# Altium project ECG_Signal_Acquisition_Device.PrjPcb
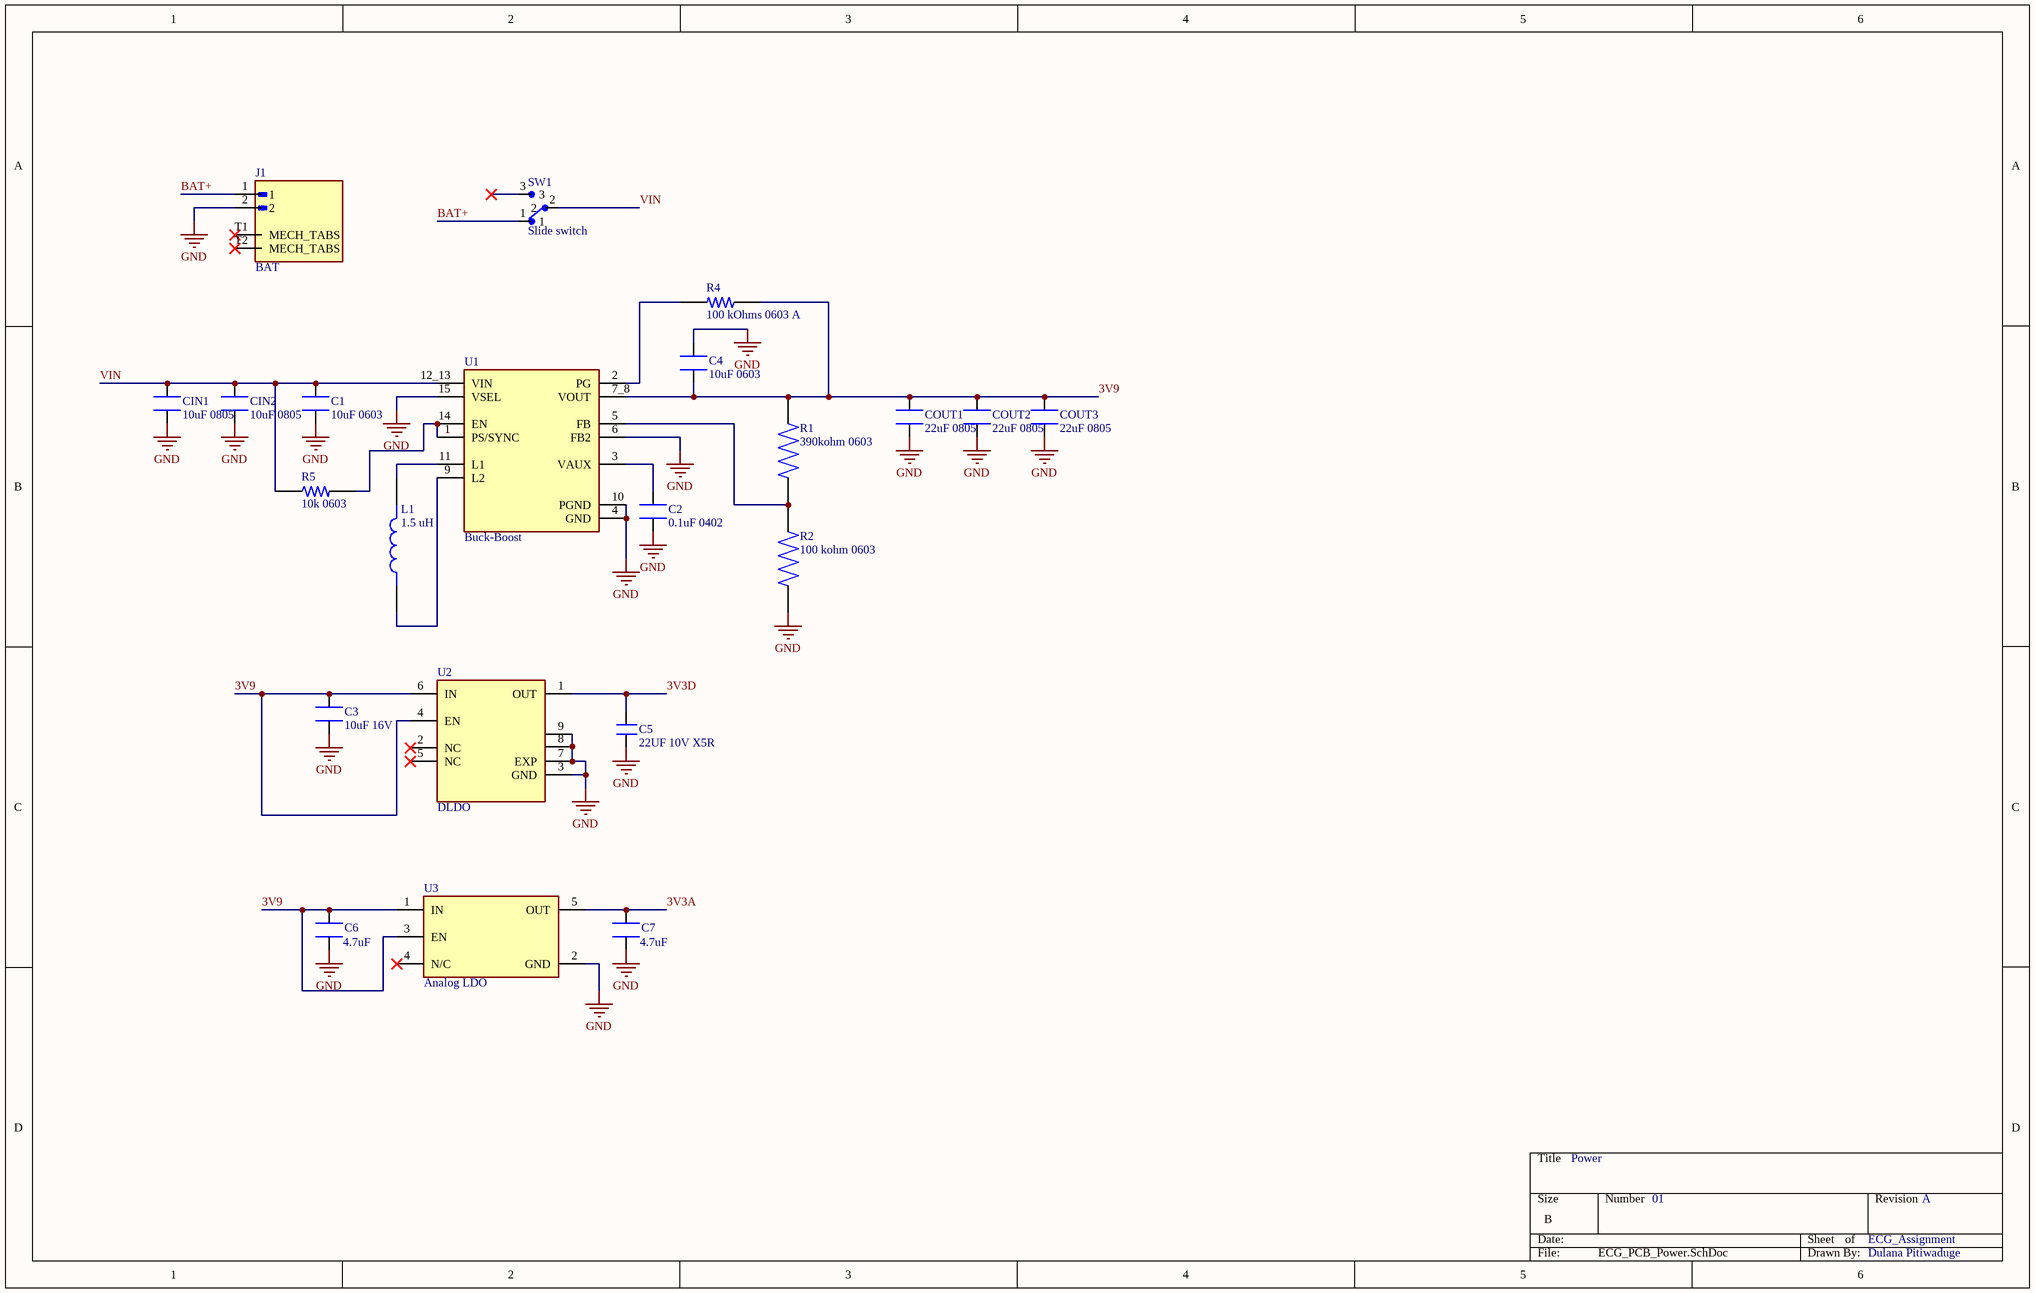
[diagram p0: ECG_PCB_Power.SchDoc]
2 sheets, 69 parts. Net scope: global (net labels, ports and power ports of the same name join across sheets).
Board file: ECG_PCB.PcbDoc
Sheets:
  ECG_PCB_Power.SchDoc
  ECG_Signal.SchDoc

## Sheet ECG_PCB_Power.SchDoc
size B; SheetNumber: 1; SheetTotal: 2

### Parts
C1  10uF 0603  [CAPC1608X100N]
C2  0.1uF 0402  [CAPC1005X55N]
C3  10uF 16V  [CAPC2012X135N]
C4  10uF 0603  [CAPC1608X100N]
C5  22UF 10V X5R  [CAP_GRM21B_MUR]
C6  4.7uF  [CAPC2012X135N]
C7  4.7uF  [CAPC2012X135N]
CIN1  10uF 0805  [CAPC2012X145N]
CIN2  10uF 0805  [CAPC2012X145N]
COUT1  22uF 0805  [CAPC2012X145N]
COUT2  22uF 0805  [CAPC2012X145N]
COUT3  22uF 0805  [CAPC2012X145N]
J1  BAT  [JST_S2B-PH-SM4-TB]
L1  1.5 uH  [IND_XFL4020-152MEC]
R1  390kohm 0603  [RESC1608X55N]
R2  100 kohm 0603  [RESC1508X50N]
R4  100 kOhms 0603 A  [RESC1607X60N]
R5  10k 0603  [RESC1607X60N]
SW1  Slide switch  [SW_1101M2S3CQE2]
U1  Buck-Boost  [VREG_TPS63070RNMR]
U2  DLDO  [VREG_TLV75733PDRVR]
U3  Analog LDO  [SOT95P280X145-5N]

### Nets
GND: C1.1 C2.1 C3.1 C4.1 C5.1 C6.2 C7.2 CIN1.1 CIN2.1 COUT1.1 COUT2.1 COUT3.1 J1.2 R2.1 U1.4(GND) U1.6(FB2) U1.10(PGND) U1.15(VSEL) U2.3(GND) U2.7(EXP) U2.8 U2.9(OUT) U3.2(GND)
3V3A: C7.1 U3.5(OUT)
3V3D: C5.2 U2.1(OUT)
3V9: C3.2 C4.2 C6.1 COUT1.2 COUT2.2 COUT3.2 R1.2 R4.1 U1.7_8(VOUT) U2.4(EN) U2.6(IN) U3.1(IN) U3.3(EN)
BAT+: J1.1 SW1.1
VIN: C1.2 CIN1.2 CIN2.2 R5.1 SW1.2 U1.12_13(VIN)
NetC2_2: C2.2 U1.3(VAUX)
NetL1_1: L1.1 U1.9(L2)
NetL1_2: L1.2 U1.11(L1)
NetR1_1: R1.1 R2.2 U1.5(FB)
NetR4_2: R4.2 U1.2(PG)
NetR5_2: R5.2 U1.1(PS/SYNC) U1.14(EN)

Not connected (* = marked no-connect by the designer): J1 T1(MECH_TABS)* T2(MECH_TABS)*; SW1 3*; U2 2(NC)* 5(NC)*; U3 4(N/C)*

### Notes on the sheet
- Power
- 01
- ECG_Assignment
- A
- Dulana Pitiwaduge

### Library data of the parts
C1 C4 = MSAST168BB5106MTNA01: 10uF 25V 20% Multilayer Ceramic Capacitor X5R 0603 (1608 Metric); MANUFACTURER: Taiyo Yuden; MAXIMUM_PACKAGE_HEIGHT: 1.00mm; Package: 1608-2 TAIYO; MPN: MSAST168BB5106MTNA01; Value: *; SOURCE_URL: https://www.snapeda.com/parts/MSAST168BB5106MTNA01/Taiyo+Yuden/view-part/; DATASHEET_URL: https://snapeda.s3.amazonaws.com/datasheet/Taiyo_Yuden_MLCC_S.pdf; STANDARD: IPC-7351B
C2 = MSAST105SB7104MFNB25: CAP CER 0.1UF 25V X7R 0402; MANUFACTURER: Taiyo Yuden; MPN: MSAST105SB7104MFNB25; MAXIMUM_PACKAGE_HEIGHT: 0.55mm; Value: *; STANDARD: IPC-7351B
C3 = GRM21BR61C106KE15L: 10 ÂµF Â±10% 16V Ceramic Capacitor X5R 0805 (2012 Metric); MF: Murata; SnapEDA_Link: https://www.snapeda.com/parts/GRM21BR61C106KE15L/Murata/view-part/?ref=snap; Package: 805-2 Murata; Value: *; MP: GRM21BR61C106KE15L; Check_prices: https://www.snapeda.com/parts/GRM21BR61C106KE15L/Murata/view-part/?ref=eda
C5 = GRM21BR61A226ME44L: CAP CER 22UF 10V X5R 0805; Manufacturer_Name: Murata; Type: Ceramic Capacitors; Copyright: Copyright (C) 2026 Ultra Librarian. All rights reserved.; Manufacturer_Part_Number: GRM21BR61A226ME44L
C6 C7 = GRM21BR71A475KA73L: SMD Capacitor X7R(EIA) with Capacitance: 4.7uF Tol. 10%. Rated Voltage: 10Vdc; MF: Murata; SnapEDA_Link: https://www.snapeda.com/parts/GRM21BR71A475KA73L/Murata/view-part/?ref=snap; Package: 2012 Murata; Value: *; MP: GRM21BR71A475KA73L; Check_prices: https://www.snapeda.com/parts/GRM21BR71A475KA73L/Murata/view-part/?ref=eda
CIN1 CIN2 = GRM21BC71E106ME11L: 0805 10 uF 25 V Â±20% Tolerance X7S Multilayer Ceramic Capacitor; MF: Murata; SnapEDA_Link: https://www.snapeda.com/parts/GRM21BC71E106ME11L/Murata/view-part/?ref=snap; Package: 2012 Murata; Value: *; MP: GRM21BC71E106ME11L; Check_prices: https://www.snapeda.com/parts/GRM21BC71E106ME11L/Murata/view-part/?ref=eda
COUT1-COUT3 = GRM21BC81C226ME44L: 0805 22 uF 16 V Â±20% Tolerance X6S Multilayer Ceramic Chip Capacitor; MF: Murata Electronics; SnapEDA_Link: https://www.snapeda.com/parts/GRM21BC81C226ME44L/Murata+Electronics+North+America/view-part/?ref=snap; Package: 2012 Murata; Value: *; MP: GRM21BC81C226ME44L; Check_prices: https://www.snapeda.com/parts/GRM21BC81C226ME44L/Murata+Electronics+North+America/view-part/?ref=eda
J1 = S2B-PH-SM4-TB: MANUFACTURER: JST Sales; UNIT: MM; MAXIMUM_PACKAGE_HEIGHT: 5.5mm; MPN: S2B-PH-SM4-TB; STANDARD: Manufacturer Recommendations; Value: *
L1 = XFL4020-152MEC: Inductor Power Shielded Wirewound 1.5uH 20% 100KHz 9.1A 15.8mOhm DCR 1515 Automotive Embossed Plastic T/R; MF: Coilcraft; SnapEDA_Link: https://www.snapeda.com/parts/XFL4020-152MEC/Coilcraft/view-part/?ref=snap; Package: None; Value: *; MP: XFL4020-152MEC; Check_prices: https://www.snapeda.com/parts/XFL4020-152MEC/Coilcraft/view-part/?ref=eda
R1 = RT0603BRD07390KL: 390 kOhms Â±0.1% 0.1W, 1/10W Chip Resistor 0603 (1608 Metric) Thin Film; MANUFACTURER: Yageo; Package: 1608 Yageo; MPN: RT0603BRD07390KL; DATASHEET_URL: https://s3.amazonaws.com/snapeda/datasheet/RT0603BRD07390KL_Yageo.pdf; Value: *; SOURCE_URL: https://www.snapeda.com/parts/RT0603BRD07390KL/Yageo/view-part/
R2 = CRCW0603100KFKEA: Resistor, Thick Film, 100 Kilohms, 0.1W, 1%, SMT, TCR 37 ppm/DegC, Tape and Reel | Vishay Dale CRCW0603100KFKEA; SnapEDA_Link: https://www.snapeda.com/parts/CRCW0603100KFKEA/Vishay+Dale/view-part/?ref=snap; Package: 1508 Vishay; Value: *; MF: Vishay; MP: CRCW0603100KFKEA; Check_prices: https://www.snapeda.com/parts/CRCW0603100KFKEA/Vishay+Dale/view-part/?ref=eda
R4 = RC0603FR-07100KL: 100 kOhms Â±1% 0.1W, 1/10W Chip Resistor 0603 (1608 Metric) Moisture Resistant Thick Film; MF: Yageo; SnapEDA_Link: https://www.snapeda.com/parts/RC0603FR-07100KL/Yageo/view-part/?ref=snap; Package: 0603 Yageo; Value: *; MP: RC0603FR-07100KL; Check_prices: https://www.snapeda.com/parts/RC0603FR-07100KL/Yageo/view-part/?ref=eda
R5 = RC0603FR-0710KL: 10 kOhms Â±1% 0.1W, 1/10W Chip Resistor 0603 (1608 Metric) Moisture Resistant Thick Film; MF: Yageo; SnapEDA_Link: https://www.snapeda.com/parts/RC0603FR-0710KL/Yageo/view-part/?ref=snap; Package: 0603 Yageo; Value: *; MP: RC0603FR-0710KL; Check_prices: https://www.snapeda.com/parts/RC0603FR-0710KL/Yageo/view-part/?ref=eda
SW1 = 1101M2S3CQE2: Switch,Slide,Sealed,SPDT,ON-NONE-ON,PC Mnt,.200 Blk Act,6A,120VAC,PC Thru-Hole | C&K 1101M2S3CQE2; SnapEDA_Link: https://www.snapeda.com/parts/1101M2S3CQE2/C%2526K/view-part/?ref=snap; Package: None; Value: *; MF: C&K; MP: 1101M2S3CQE2; Check_prices: https://www.snapeda.com/parts/1101M2S3CQE2/C%2526K/view-part/?ref=eda
U1 = TPS63070RNMR: Wide input voltage (2V-16V) buck-boost converter; MF: Texas Instruments; SnapEDA_Link: https://www.snapeda.com/parts/TPS63070RNMR/Texas+Instruments/view-part/?ref=snap; Package: VQFN-HR-15 Texas Instruments; Value: *; MP: TPS63070RNMR; Check_prices: https://www.snapeda.com/parts/TPS63070RNMR/Texas+Instruments/view-part/?ref=eda
U2 = TLV75733PDRVR: 1-A, low-IQ high-accuracy low-dropout (LDO) voltage regulator with enable; MF: Texas Instruments; SnapEDA_Link: https://www.snapeda.com/parts/TLV75733PDRVR/Texas+Instruments/view-part/?ref=snap; Package: WSON-6 Texas Instruments; Value: *; MP: TLV75733PDRVR; Check_prices: https://www.snapeda.com/parts/TLV75733PDRVR/Texas+Instruments/view-part/?ref=eda
U3 = TPS7A2033PDBVR: 300-mA ultra-low-noise low-IQ low-dropout (LDO) linear regulator with high PSRR; MF: Texas Instruments; SnapEDA_Link: https://www.snapeda.com/parts/TPS7A2033PDBVR/Texas+Instruments/view-part/?ref=snap; Package: SOT-23 Texas Instruments; Value: *; MP: TPS7A2033PDBVR; Check_prices: https://www.snapeda.com/parts/TPS7A2033PDBVR/Texas+Instruments/view-part/?ref=eda

## Sheet ECG_Signal.SchDoc
size A3; SheetNumber: 2; SheetTotal: 2
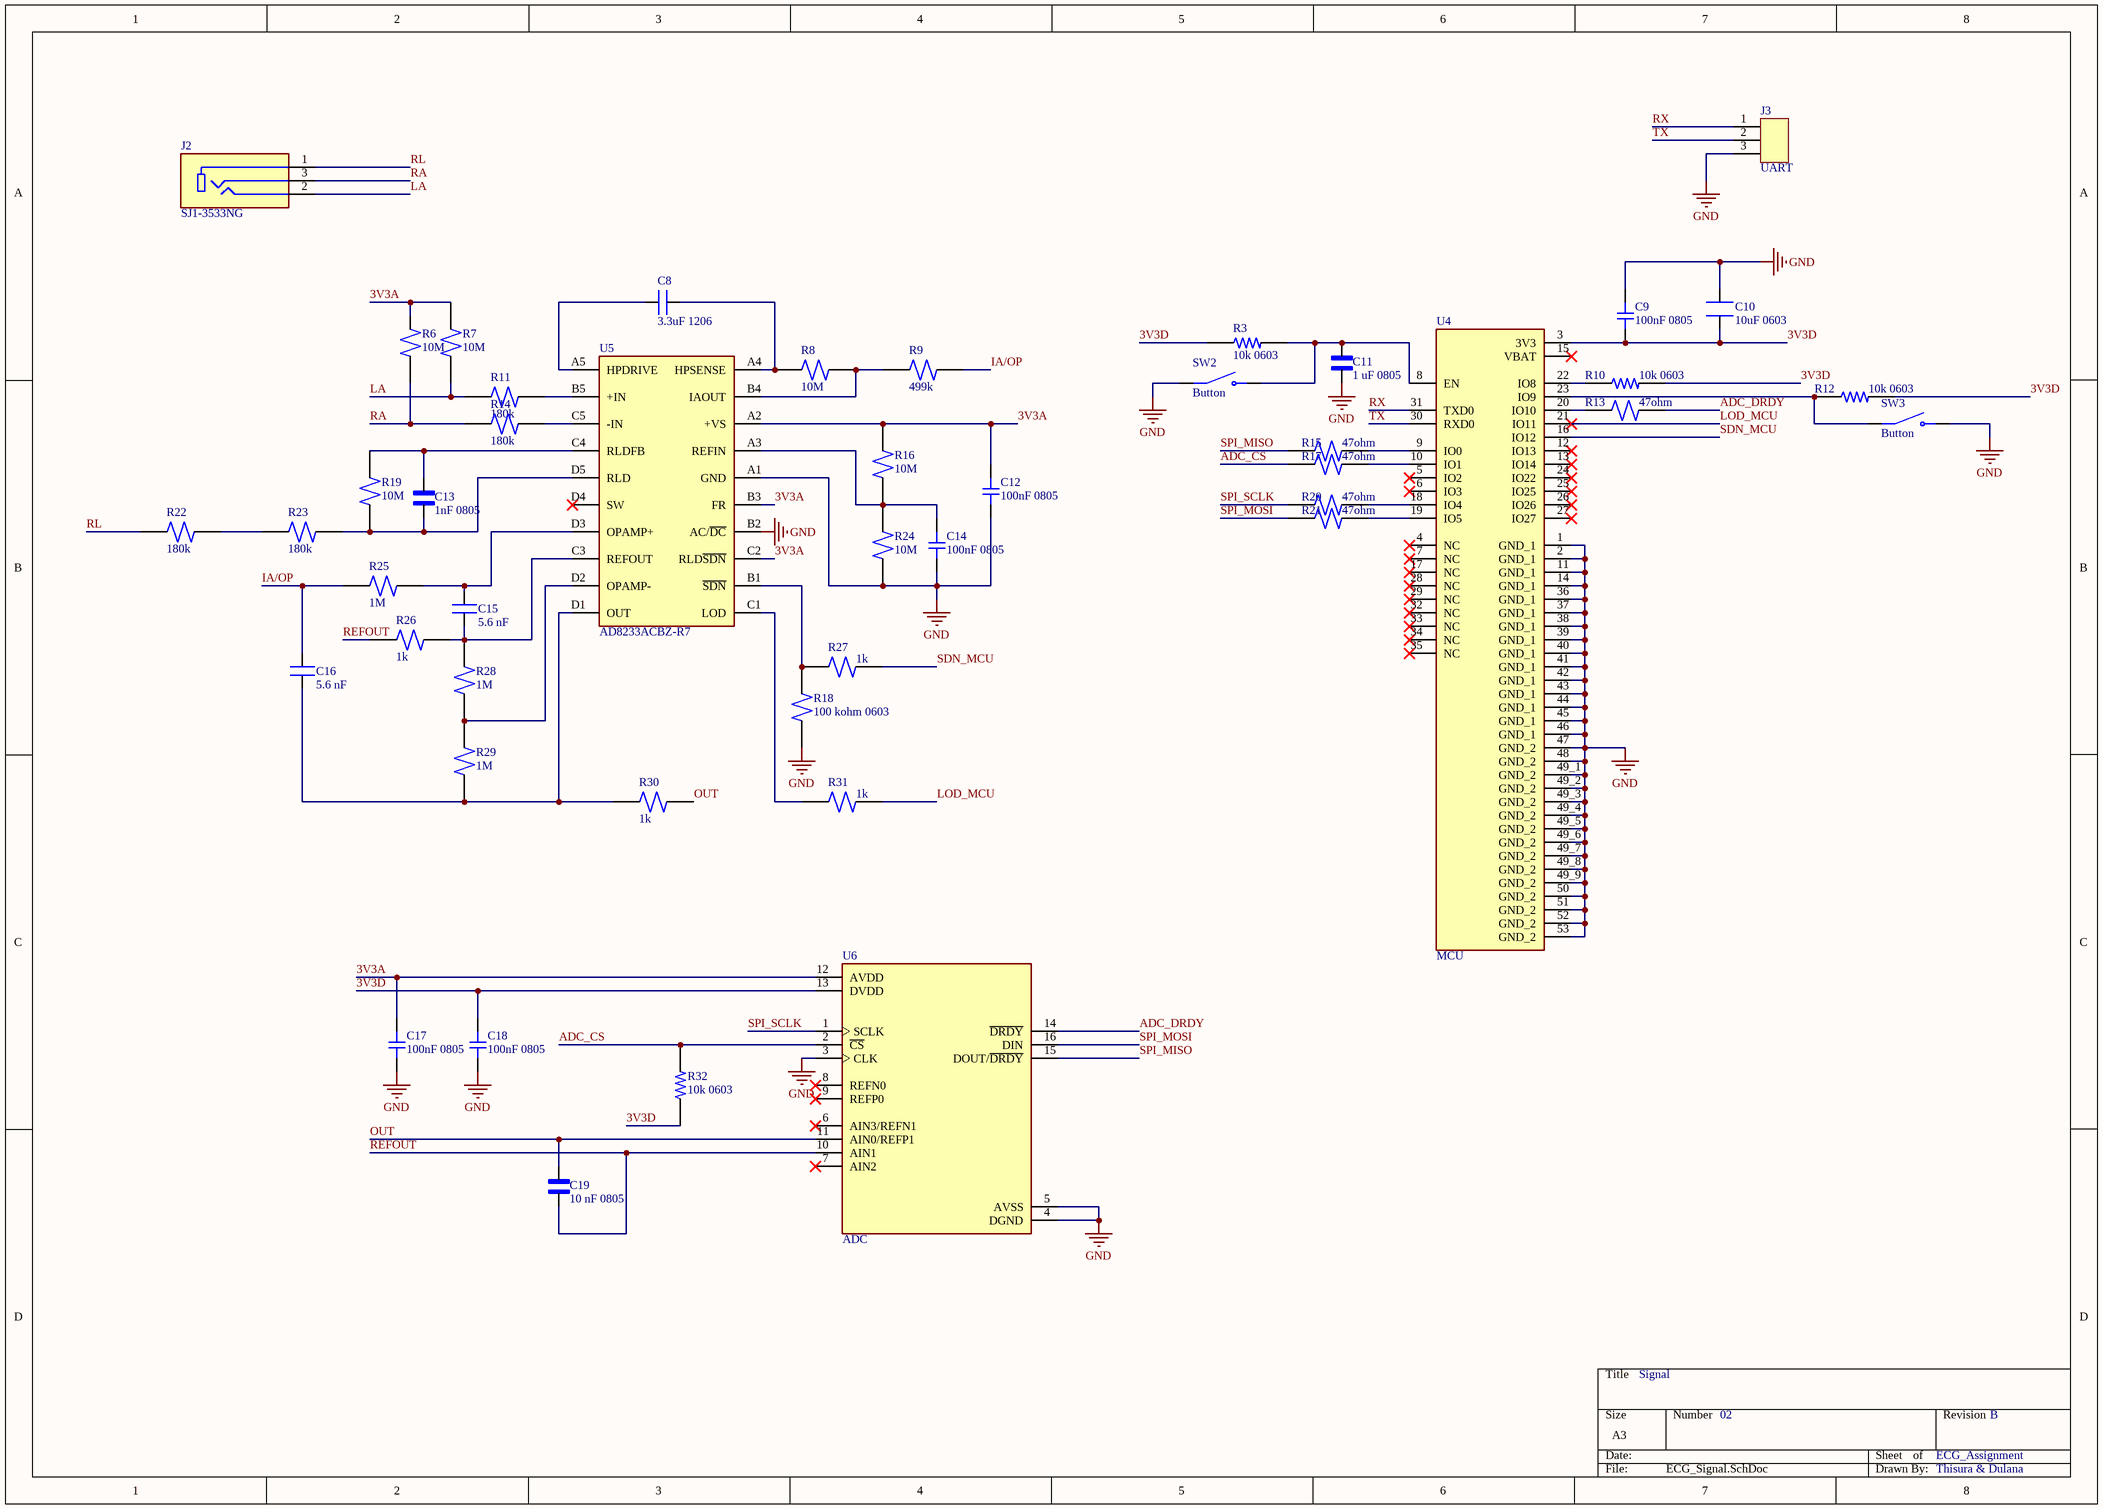
[diagram p1: ECG_Signal.SchDoc]

### Parts
C8  3.3uF 1206  [CAPC340180_180N_KEM]
C9  100nF 0805  [CAPC2012X88N]
C10  10uF 0603  [CAPC1608X100N]
C11  1 uF 0805  [CAPC2012X88N]
C12  100nF 0805  [CAPC2012X88N]
C13  1nF 0805  [CAPC2012X88N]
C14  100nF 0805  [CAPC2012X88N]
C15  5.6 nF  [CAPC220145_88N_KEM]
C16  5.6 nF  [CAPC220145_88N_KEM]
C17  100nF 0805  [CAPC2012X88N]
C18  100nF 0805  [CAPC2012X88N]
C19  10 nF 0805  [CAPC2012X140N]
J2  SJ1-3533NG  [CUI_SJ1-3533NG]
J3  UART  [CONN_PH1-03-UA_ADM]
R3  10k 0603  [RESC1607X60N]
R6  10M  [RESC2012X60N]
R7  10M  [RESC2012X60N]
R8  10M  [RESC2012X60N]
R9  499k  [RESC2012X60N]
R10  10k 0603  [RESC1607X60N]
R11  180k  [RESC2012X60N]
R12  10k 0603  [RESC1607X60N]
R13  47ohm  [RESC1005X35N]
R14  180k  [RESC2012X60N]
R15  47ohm  [RESC1005X35N]
R16  10M  [RESC2012X60N]
R17  47ohm  [RESC1005X35N]
R18  100 kohm 0603  [RESC1508X50N]
R19  10M  [RESC2012X60N]
R20  47ohm  [RESC1005X35N]
R21  47ohm  [RESC1005X35N]
R22  180k  [RESC2012X60N]
R23  180k  [RESC2012X60N]
R24  10M  [RESC2012X60N]
R25  1M  [RESC2012X60N]
R26  1k  [RESC2012X60N]
R27  1k  [RESC2012X60N]
R28  1M  [RESC2012X60N]
R29  1M  [RESC2012X60N]
R30  1k  [RESC2012X60N]
R31  1k  [RESC2012X60N]
R32  10k 0603  [RESC1607X60N]
SW2  Button  [SW_B3U-1000P]
SW3  Button  [SW_B3U-1000P]
U4  MCU  [MODULE_ESP32-H2-MINI-1-H2]
U5  AD8233ACBZ-R7  [BGA20N40P5X4_204X170X56N]
U6  ADC  [SOP65P640X120-16N]

### Nets
GND: C9.1(A) C10.2 C11.2 C12.2(B) C14.2(B) C17.1(A) C18.1(A) J3.3 R18.1 R24.1 SW2.1 SW3.2 U4.1(GND_1) U4.2(GND_1) U4.11(GND_1) U4.14(GND_1) U4.36(GND_1) U4.37(GND_1) U4.38(GND_1) U4.39(GND_1) U4.40(GND_1) U4.41(GND_1) U4.42(GND_1) U4.43(GND_1) U4.44(GND_1) U4.45(GND_1) U4.46(GND_1) U4.47(GND_2) U4.48(GND_2) U4.49_1(GND_2) U4.49_2(GND_2) U4.49_3(GND_2) U4.49_4(GND_2) U4.49_5(GND_2) U4.49_6(GND_2) U4.49_7(GND_2) U4.49_8(GND_2) U4.49_9(GND_2) U4.50(GND_2) U4.51(GND_2) U4.52(GND_2) U4.53(GND_2) U5.A1(GND) U5.B2(AC/~{DC}) U6.3(CLK) U6.4(DGND) U6.5(AVSS)
3V3A: C12.1(A) C17.2(B) R6.2 R7.2 R16.2 U5.A2(+VS) U5.B3(FR) U5.C2(RLD~{SDN}) U6.12(AVDD)
3V3D: C9.2(B) C10.1 C18.2(B) R3.1 R10.2 R12.2 R32.1 U4.3(3V3) U6.13(DVDD)
ADC_CS: R17.1 R32.2 U6.2(~{CS})
ADC_DRDY: R13.2 U6.14(~{DRDY})
IA/OP: C16.1 R9.2 R25.1
LA: J2.2 R7.1 R11.1
LOD_MCU: R31.2 U4.21(IO11)
OUT: C19.2 R30.2 U6.11(AIN0/REFP1)
RA: J2.3 R6.1 R14.1
REFOUT: C19.1 R26.1 U6.10(AIN1)
RL: J2.1 R22.1
RX: J3.1 U4.31(TXD0)
SDN_MCU: R27.2 U4.16(IO12)
SPI_MISO: R15.1 U6.15(DOUT/~{DRDY})
SPI_MOSI: R21.1 U6.16(DIN)
SPI_SCLK: R20.1 U6.1(SCLK)
TX: J3.2 U4.30(RXD0)
NetC8_1: C8.1 U5.A5(HPDRIVE)
NetC8_2: C8.2 R8.1 U5.A4(HPSENSE)
NetC11_1: C11.1 R3.2 SW2.2 U4.8(EN)
NetC13_1: C13.1 R19.1 R23.2 U5.D5(RLD)
NetC13_2: C13.2 R19.2 U5.C4(RLDFB)
NetC14_1: C14.1(A) R16.1 R24.2 U5.A3(REFIN)
NetC15_1: C15.1 R26.2 R28.2 U5.C3(REFOUT)
NetC15_2: C15.2 R25.2 U5.D3(OPAMP+)
NetC16_2: C16.2 R29.1 R30.1 U5.D1(OUT)
NetR8_2: R8.2 R9.1 U5.B4(IAOUT)
NetR10_1: R10.1 U4.22(IO8)
NetR11_2: R11.2 U5.B5(+IN)
NetR12_1: R12.1 SW3.1 U4.23(IO9)
NetR13_1: R13.1 U4.20(IO10)
NetR14_2: R14.2 U5.C5(-IN)
NetR15_2: R15.2 U4.9(IO0)
NetR17_2: R17.2 U4.10(IO1)
NetR18_2: R18.2 R27.1 U5.B1(~{SDN})
NetR20_2: R20.2 U4.18(IO4)
NetR21_2: R21.2 U4.19(IO5)
NetR22_2: R22.2 R23.1
NetR28_1: R28.1 R29.2 U5.D2(OPAMP-)
NetR31_1: R31.1 U5.C1(LOD)

Not connected (* = marked no-connect by the designer): U4 4(NC)* 5(IO2)* 6(IO3)* 7(NC)* 12(IO13)* 13(IO14)* 15(VBAT)* 17(NC)* 24(IO22)* 25(IO25)* 26(IO26)* 27(IO27)* 28(NC)* 29(NC)* 32(NC)* 33(NC)* 34(NC)* 35(NC)*; U5 D4(SW)*; U6 6(AIN3/REFN1)* 7(AIN2)* 8(REFN0)* 9(REFP0)*

### Notes on the sheet
- Signal
- 02
- ECG_Assignment
- B
- Thisura & Dulana

### Library data of the parts
C8 = C1206C335K3RACTU: SMD Comm X7R, Ceramic, 3.3 uF, 10%, 25 VDC, X7R, SMD, MLCC, Temperature Stable, Class II, 1206; Manufacturer_Name: Kemet; Copyright: Copyright (C) 2026 Ultra Librarian. All rights reserved.; Manufacturer_Part_Number: C1206C335K3RACTU; Datasheet: https://content.kemet.com/datasheets/KEM_C1002_X7R_SMD.pdf
C9 C12 C14 C17 C18 = C0805C104K5RACTU: Capacitor, Ceramic, Cap, .100uF, Tol 10%, SMT, 50V, X7R, Tape/Reel | KEMET C0805C104K5RACTU; SnapEDA_Link: https://www.snapeda.com/parts/C0805C104K5RACTU/KEMET/view-part/?ref=snap; Package: Package; Value: *; MF: KEMET; MP: C0805C104K5RACTU; Check_prices: https://www.snapeda.com/parts/C0805C104K5RACTU/KEMET/view-part/?ref=eda
C10 = MSAST168BB5106MTNA01: as C1 on sheet ECG_PCB_Power; MAXIMUM_PACKAGE_HEIGHT: 1.00mm; Package: 1608-2 TAIYO; MPN: MSAST168BB5106MTNA01; Value: *; SOURCE_URL: https://www.snapeda.com/parts/MSAST168BB5106MTNA01/Taiyo+Yuden/view-part/; DATASHEET_URL: https://snapeda.s3.amazonaws.com/datasheet/Taiyo_Yuden_MLCC_S.pdf; STANDARD: IPC-7351B
C11 = C0805C105K4RACTU: Capacitor,Ceramic,Cap 1 uF,Tol 10%,Vol-Rtg 16 VDC,SMT,0805,X7R,Tape & Reel | KEMET C0805C105K4RACTU; SnapEDA_Link: https://www.snapeda.com/parts/C0805C105K4RACTU/KEMET/view-part/?ref=snap; Package: 805-2 KEMET; Value: *; MF: KEMET; MP: C0805C105K4RACTU; Check_prices: https://www.snapeda.com/parts/C0805C105K4RACTU/KEMET/view-part/?ref=eda
C13 = C0805C102J5GACTU: CAP, 1000PF, 50V, 5%, C0G/NP0, 0805; Capacitance:1000pF; Voltage Rating:50V; Ceramic Capacitor Case:0805 [2012 Metric]; Capacitance Tolerance:Â± 5%; Dielectric Characteristic:C0G / NP0; Product Range:C Series KEMET; Opera; MP: C0805C102J5GAC-TU; SnapEDA_Link: https://www.snapeda.com/parts/C0805C102J5GAC-TU/Kemet/view-part/?ref=snap; Package: Package; Value: *; MF: KEMET; Check_prices: https://www.snapeda.com/parts/C0805C102J5GAC-TU/Kemet/view-part/?ref=eda
C15 C16 = C0805C562J5GACTU: SMD Comm C0G, Ceramic, 5600 pF, 5%, 50 VDC, C0G, SMD, MLCC, Ultra-Stable, Low Loss, Class I, 0805; Manufacturer_Name: Kemet; Copyright: Copyright (C) 2025 Ultra Librarian. All rights reserved.; Manufacturer_Part_Number: C0805C562J5GACTU
C19 = C0805C103J5GACTU: 0805 C 10nF Ceramic Multilayer Capacitor, 50 V, +125degC, C0G Dielectric, +/-5% | KEMET C0805C103J5GACTU; SnapEDA_Link: https://www.snapeda.com/parts/C0805C103J5GACTU/KEMET/view-part/?ref=snap; Package: 0805 Kemet; Value: *; MF: KEMET; MP: C0805C103J5GACTU; Check_prices: https://www.snapeda.com/parts/C0805C103J5GACTU/KEMET/view-part/?ref=eda
J2 = SJ1-3533NG: 3.5 mm Right-Angle Stereo Jack, 3 Pin PCB Mount, Isolated Ground; MF: Same Sky; SnapEDA_Link: https://www.snapeda.com/parts/SJ1-3533NG/Same+Sky/view-part/?ref=snap; Package: None; Value: *; MP: SJ1-3533NG; Check_prices: https://www.snapeda.com/parts/SJ1-3533NG/Same+Sky/view-part/?ref=eda
J3 = PH1-03-UA: Description; Manufacturer_Name: ADAM TECHNOLOGIES INC; Copyright: Copyright (C) 2025 Ultra Librarian. All rights reserved.; Manufacturer_Part_Number: PH1-03-UA; RefDes: RefDes; Type: Type
R3 R10 R12 R32 = RC0603FR-0710KL: as R5 on sheet ECG_PCB_Power; SnapEDA_Link: https://www.snapeda.com/parts/RC0603FR-0710KL/Yageo/view-part/?ref=snap; Package: 0603 Yageo; Value: *; MP: RC0603FR-0710KL; Check_prices: https://www.snapeda.com/parts/RC0603FR-0710KL/Yageo/view-part/?ref=eda
R6-R8 R16 R19 R24 = RC0805FR-0710ML: 10 MOhms Â±1% 0.125W, 1/8W Chip Resistor 0805 (2012 Metric) Moisture Resistant Thick Film; MF: Yageo; SnapEDA_Link: https://www.snapeda.com/parts/RC0805FR-0710ML/Yageo/view-part/?ref=snap; Package: 2012 Yageo; Value: *; MP: RC0805FR-0710ML; Check_prices: https://www.snapeda.com/parts/RC0805FR-0710ML/Yageo/view-part/?ref=eda
R9 = RC0805FR-07499KL: 0805 (2012 mÃ©trico), 499 kOhms Â±1%, 0,125 W, 1/8 W, pelÃ­cula gruesa resistente a la humedad; MF: Yageo; SnapEDA_Link: https://www.snapeda.com/parts/RC0805FR-07499KL/Yageo/view-part/?ref=snap; Package: 2012 Yageo; Value: *; MP: RC0805FR-07499KL; Check_prices: https://www.snapeda.com/parts/RC0805FR-07499KL/Yageo/view-part/?ref=eda
R11 R14 R22 R23 = RC0805FR-07180KL: 180 kOhms Â±1% 0.125W, 1/8W Chip Resistor 0805 (2012 Metric) Moisture Resistant Thick Film; MF: Yageo; SnapEDA_Link: https://www.snapeda.com/parts/RC0805FR-07180KL/Yageo/view-part/?ref=snap; Package: 2012 Yageo; Value: *; MP: RC0805FR-07180KL; Check_prices: https://www.snapeda.com/parts/RC0805FR-07180KL/Yageo/view-part/?ref=eda
R13 R15 R17 R20 R21 = RMCF0402JT47R0: 47 Ohms Â±5% 0.063W, 1/16W Chip Resistor 0402 (1005 Metric) Automotive AEC-Q200 Thick Film; MF: Stackpole Electronics Inc; SnapEDA_Link: https://www.snapeda.com/parts/RMCF0402JT47R0/Stackpole+Electronics/view-part/?ref=snap; Package: 1005 Stackpole; Value: *; MP: RMCF0402JT47R0; Check_prices: https://www.snapeda.com/parts/RMCF0402JT47R0/Stackpole+Electronics/view-part/?ref=eda
R18 = CRCW0603100KFKEA: as R2 on sheet ECG_PCB_Power; SnapEDA_Link: https://www.snapeda.com/parts/CRCW0603100KFKEA/Vishay+Dale/view-part/?ref=snap; Package: 1508 Vishay; Value: *; MF: Vishay; MP: CRCW0603100KFKEA; Check_prices: https://www.snapeda.com/parts/CRCW0603100KFKEA/Vishay+Dale/view-part/?ref=eda
R25 R28 R29 = RC0805FR-071ML: 1 MOhms Â±1% 0.125W, 1/8W Chip Resistor 0805 (2012 Metric) Moisture Resistant Thick Film; MF: Yageo; SnapEDA_Link: https://www.snapeda.com/parts/RC0805FR-071ML/Yageo/view-part/?ref=snap; Package: 2012 Yageo; Value: *; MP: RC0805FR-071ML; Check_prices: https://www.snapeda.com/parts/RC0805FR-071ML/Yageo/view-part/?ref=eda
R26 R27 R30 R31 = RC0805FR-071KL: 1 kOhms Â±1% 0.125W, 1/8W Chip Resistor 0805 (2012 Metric) Moisture Resistant Thick Film; MF: Yageo; DigiKey_Part_Number: 311-1.00KCRTR-ND; Purchase-URL: https://pricing.snapeda.com/search?q=RC0805FR-071KL&ref=eda; Package: 2012 Yageo; Check_prices: https://www.snapeda.com/parts/RC0805FR-071KL/Yageo/view-part/?ref=eda; Value: *; SnapEDA_Link: https://www.snapeda.com/parts/RC0805FR-071KL/Yageo/view-part/?ref=snap; MP: RC0805FR-071KL
SW2 SW3 = B3U-1000P: Switch Tactile N.O. SPST Round Button Gull Wing 0.05A 12VDC 1.5N SMD Embossed T/R; Price: None; MP: B3U-1000P; Availability: Unavailable; Value: *; Package: None
U4 = ESP32-H2-MINI-1-H2: 802.15.4, Bluetooth Bluetooth v5.3, ZigbeeÂ® Transceiver Module 2.4GHz Integrated, Trace Surface Mount; MF: Espressif Systems; SnapEDA_Link: https://www.snapeda.com/parts/ESP32-H2-MINI-1-H2/Espressif+Systems/view-part/?ref=snap; Package: SMD-53 Espressif Systems; Value: *; MP: ESP32-H2-MINI-1-H2; Check_prices: https://www.snapeda.com/parts/ESP32-H2-MINI-1-H2/Espressif+Systems/view-part/?ref=eda
U5 = AD8233ACBZ-R7: 50 Î¼A, 2 mm Ã— 1.7 mm WLCSP, Low Noise, Heart Rate Monitor for Wearable Products; MF: Analog Devices; SnapEDA_Link: https://www.snapeda.com/parts/AD8233ACBZ-R7/Analog+Devices/view-part/?ref=snap; Package: WLCSP -20 Analog Devices; Value: *; MP: AD8233ACBZ-R7; Check_prices: https://www.snapeda.com/parts/AD8233ACBZ-R7/Analog+Devices/view-part/?ref=eda
U6 = ADS1220IPWR: 24-bit, 2-kSPS, four-channel, low-power, delta-sigma ADC with PGA, VREF, SPI and two IDACs; MF: Texas Instruments; SnapEDA_Link: https://www.snapeda.com/parts/ADS1220IPWR/Texas+Instruments/view-part/?ref=snap; Package: TSSOP-16 Texas Instruments; Value: *; MP: ADS1220IPWR; Check_prices: https://www.snapeda.com/parts/ADS1220IPWR/Texas+Instruments/view-part/?ref=eda

## Nets that join several sheets
GND: ECG_PCB_Power (23 pins), ECG_Signal (47 pins)
3V3A: ECG_PCB_Power (C7.1 U3.5), ECG_Signal (9 pins)
3V3D: ECG_PCB_Power (C5.2 U2.1), ECG_Signal (9 pins)